# Altium schematic sheet 02 BM20P.SchDoc
size 246 x 182 mm
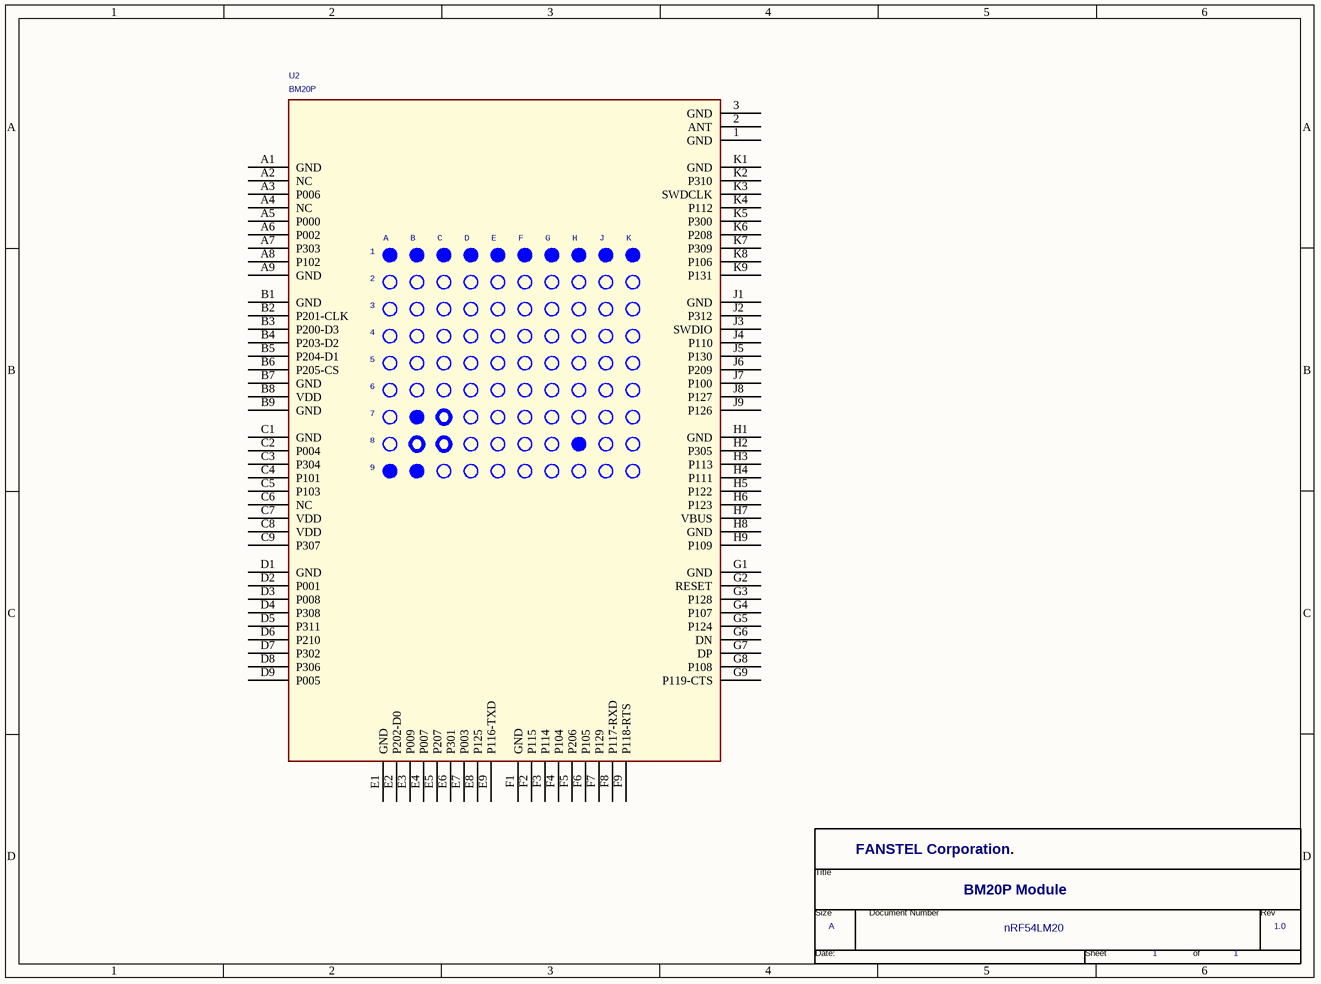
[diagram p0: 02 BM20P.SchDoc]

## Parts
*  Doc: nRF54LM20  RevCode: 1.0  Title: BM20P Module  OrgName: FANSTEL Corporation.  Page Size: A  Page Number: 1  (hidden comment: TitleBlock1)  (graphical)
U2  BM20P  [NRF51822-44P]

## Nets

Not connected (* = marked no-connect by the designer): U2 1(GND) 2(ANT) 3(GND) A1(GND) A2(NC) A3(P006) A4(NC) A5(P000) A6(P002) A7(P303) A8(P102) A9(GND) B1(GND) B2(P201-CLK) B3(P200-D3) B4(P203-D2) B5(P204-D1) B6(P205-CS) B7(GND) B8(VDD) B9(GND) C1(GND) C2(P004) C3(P304) C4(P101) C5(P103) C6(NC) C7(VDD) C8(VDD) C9(P307) D1(GND) D2(P001) D3(P008) D4(P308) D5(P311) D6(P210) D7(P302) D8(P306) D9(P005) E1(GND) E2(P202-D0) E3(P009) E4(P007) E5(P207) E6(P301) E7(P003) E8(P125) E9(P116-TXD) F1(GND) F2(P115) F3(P114) F4(P104) F5(P206) F6(P105) F7(P129) F8(P117-RXD) F9(P118-RTS) G1(GND) G2(RESET) G3(P128) G4(P107) G5(P124) G6(DN) G7(DP) G8(P108) G9(P119-CTS) H1(GND) H2(P305) H3(P113) H4(P111) H5(P122) H6(P123) H7(VBUS) H8(GND) H9(P109) J1(GND) J2(P312) J3(SWDIO) J4(P110) J5(P130) J6(P209) J7(P100) J8(P127) J9(P126) K1(GND) K2(P310) K3(SWDCLK) K4(P112) K5(P300) K6(P208) K7(P309) K8(P106) K9(P131)

## Notes on the sheet
- (in symbol NRF51822-44P_57) A; B; C; D; E; F; G; H; J; K; 4; 5; 6; 7; 8; 9
- (in symbol TitleBlock1) Title; Size; Document Number; Rev; Date:; Sheet; of

## Library data of the parts
U2 = NRF51822-44P_57
* = TitleBlock1: Page Create Date: March  8, 1995; Page Count: 1